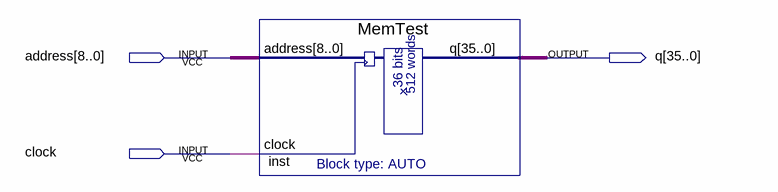
[diagram p0: schematic sheet]
// Quartus schematic MemTest_top.bdf as structural Verilog: 1 symbols, 3 pins
module MemTest_top (
  input  [8:0] address,
  input  clock,
  output [35:0] q
);

  MemTest inst (.address(address), .clock(clock), .q(q));
endmodule
